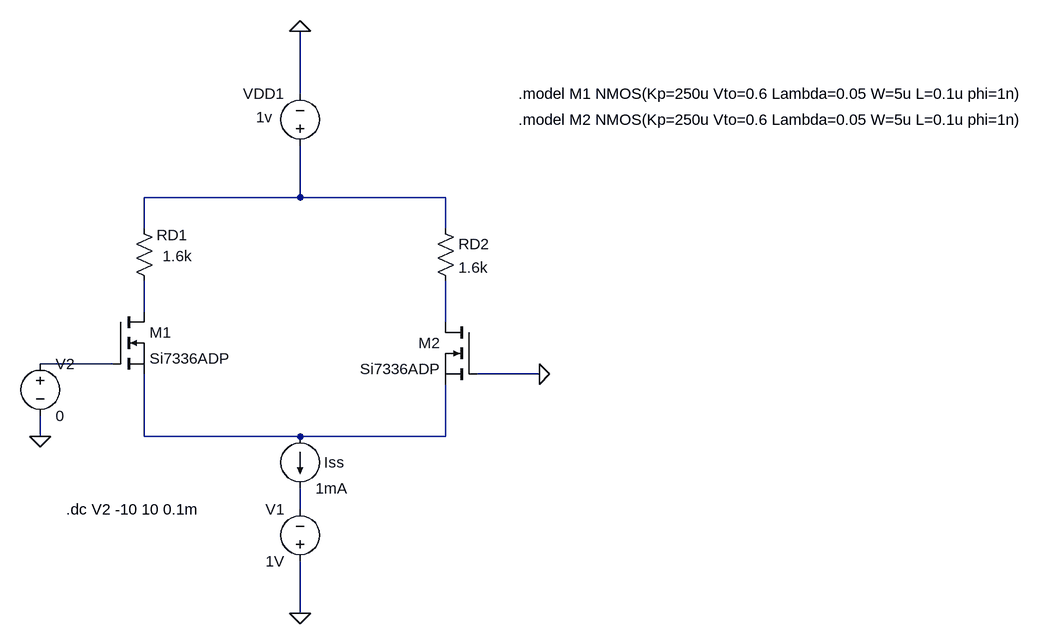
[diagram p0: schematic 1.asc]
1.asc, the LTspice schematic file:
Version 4
SHEET 1 1512 772
WIRE 144 -240 144 -336
WIRE 144 -80 144 -160
WIRE 144 -80 -96 -80
WIRE 368 -80 144 -80
WIRE -96 -32 -96 -80
WIRE 368 -32 368 -80
WIRE -96 96 -96 48
WIRE 368 112 368 48
WIRE -144 176 -256 176
WIRE 512 192 416 192
WIRE -256 288 -256 256
WIRE -96 288 -96 192
WIRE 144 288 -96 288
WIRE 368 288 368 208
WIRE 368 288 144 288
WIRE 144 400 144 368
WIRE 144 560 144 480
FLAG 144 560 0
FLAG 144 -336 0
FLAG -256 288 0
FLAG 512 192 0
SYMBOL nmos -144 96 R0
SYMATTR InstName M1
SYMATTR Value Si7336ADP
SYMBOL nmos 416 112 M0
SYMATTR InstName M2
SYMATTR Value Si7336ADP
SYMBOL current 144 288 R0
WINDOW 0 37 40 Left 2
WINDOW 123 0 0 Left 0
WINDOW 39 0 0 Left 0
SYMATTR InstName Iss
SYMATTR Value 1mA
SYMBOL voltage 144 496 R180
WINDOW 0 24 96 Left 2
WINDOW 3 24 16 Left 2
SYMATTR InstName V1
SYMATTR Value 1V
SYMBOL res -112 -48 R0
WINDOW 0 35 26 Left 2
WINDOW 3 44 58 Left 2
SYMATTR InstName RD1
SYMATTR Value 1.6k
SYMBOL res 352 -48 R0
SYMATTR InstName RD2
SYMATTR Value 1.6k
SYMBOL voltage 144 -144 R180
WINDOW 0 24 96 Left 2
WINDOW 3 42 60 Left 2
WINDOW 123 0 0 Left 0
WINDOW 39 0 0 Left 0
SYMATTR InstName VDD1
SYMATTR Value 1v
SYMBOL voltage -256 160 R0
WINDOW 123 0 0 Left 0
WINDOW 39 0 0 Left 0
SYMATTR InstName V2
SYMATTR Value 0
TEXT 480 -240 Left 2 !.model M1 NMOS(Kp=250u Vto=0.6 Lambda=0.05 W=5u L=0.1u phi=1n)
TEXT 480 -200 Left 2 !.model M2 NMOS(Kp=250u Vto=0.6 Lambda=0.05 W=5u L=0.1u phi=1n)
TEXT -216 400 Left 2 !.dc V2 -10 10 0.1m

The netlist it stands for:
* 1.asc
M1 N002 N004 N005 N005 Si7336ADP
M2 N003 0 N005 N005 Si7336ADP
Iss N005 N006 1mA
V1 0 N006 1V
RD1 N001 N002 1.6k
RD2 N001 N003 1.6k
VDD1 N001 0 1v
V2 N004 0 0
.model NMOS NMOS
.model PMOS PMOS
.lib standard.mos
.model M1 NMOS(Kp=250u Vto=0.6 Lambda=0.05 W=5u L=0.1u phi=1n)
.model M2 NMOS(Kp=250u Vto=0.6 Lambda=0.05 W=5u L=0.1u phi=1n)
.dc V2 -10 10 0.1m
.backanno
.end